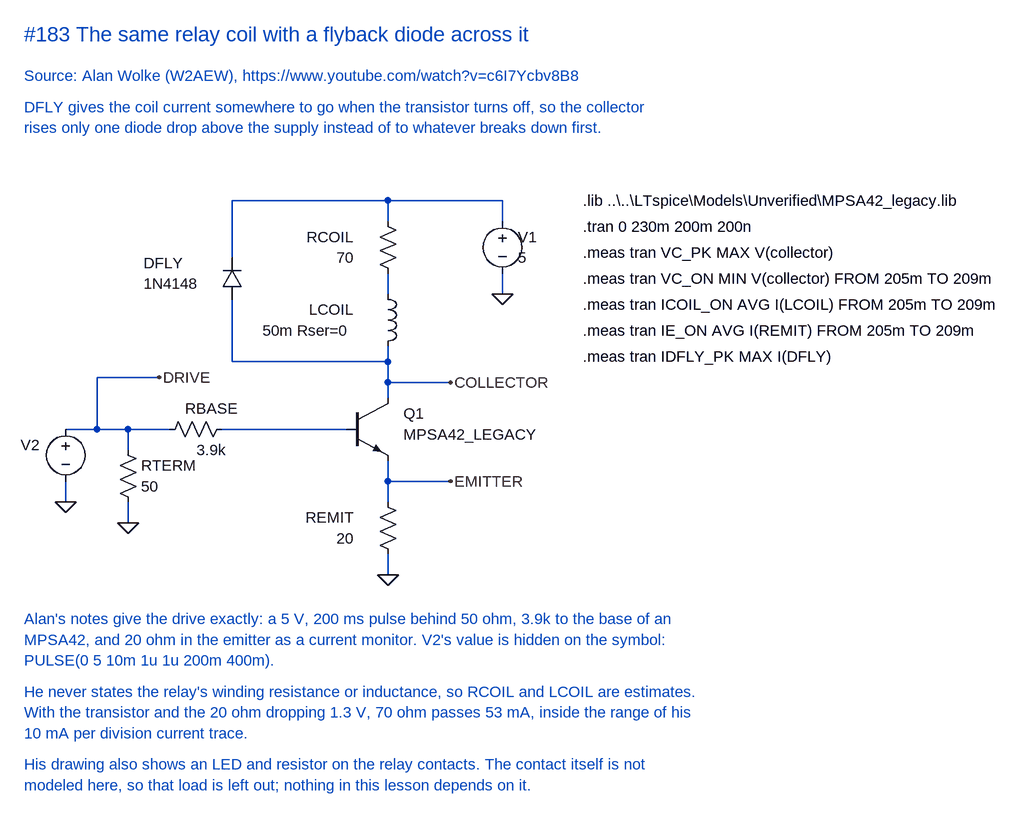
[diagram p0: schematic Relay with flyback diode.asc]
Relay with flyback diode.asc, the LTspice schematic file:
Version 4
SHEET 1 2000 1100
WIRE 480 256 720 256
WIRE 720 256 896 256
WIRE 480 256 480 344
WIRE 480 408 480 504
WIRE 480 504 720 504
WIRE 720 256 720 288
WIRE 896 256 896 288
WIRE 896 368 896 400
WIRE 720 368 720 400
WIRE 720 480 720 504
WIRE 720 504 720 536
WIRE 720 536 720 560
WIRE 720 536 816 536
WIRE 464 608 656 608
WIRE 320 608 384 608
WIRE 224 608 272 608
WIRE 272 608 320 608
WIRE 272 608 272 528
WIRE 272 528 368 528
WIRE 320 608 320 640
WIRE 320 720 320 752
WIRE 224 688 224 720
WIRE 720 656 720 688
WIRE 720 688 720 720
WIRE 720 688 816 688
WIRE 720 800 720 832
FLAG 896 400 0
FLAG 320 752 0
FLAG 224 720 0
FLAG 720 832 0
FLAG 816 536 COLLECTOR
FLAG 816 688 EMITTER
FLAG 368 528 DRIVE
SYMBOL diode 496 408 R180
WINDOW 0 152 56 Right 2
WINDOW 3 152 24 Right 2
SYMATTR InstName DFLY
SYMATTR Value 1N4148
SYMBOL voltage 896 272 R0
WINDOW 0 24 40 Left 2
WINDOW 3 24 72 Left 2
SYMATTR InstName V1
SYMATTR Value 5
SYMBOL voltage 224 592 R0
WINDOW 0 -40 40 Right 2
WINDOW 3 0 0 Invisible 2
SYMATTR InstName V2
SYMATTR Value PULSE(0 5 10m 1u 1u 200m 400m)
SYMBOL res 304 624 R0
WINDOW 0 36 40 Left 2
WINDOW 3 36 72 Left 2
SYMATTR InstName RTERM
SYMATTR Value 50
SYMBOL res 480 592 R90
WINDOW 0 0 32 VBottom 2
WINDOW 3 32 32 VTop 2
SYMATTR InstName RBASE
SYMATTR Value 3.9k
SYMBOL res 704 272 R0
WINDOW 0 -36 40 Right 2
WINDOW 3 -36 72 Right 2
SYMATTR InstName RCOIL
SYMATTR Value 70
SYMBOL ind 704 384 R0
WINDOW 0 -36 40 Right 2
WINDOW 3 -44 72 Right 2
SYMATTR InstName LCOIL
SYMATTR Value 50m Rser=0
SYMBOL npn 656 560 R0
WINDOW 0 88 24 Left 2
WINDOW 3 88 56 Left 2
SYMATTR InstName Q1
SYMATTR Value MPSA42_LEGACY
SYMBOL res 704 704 R0
WINDOW 0 -36 40 Right 2
WINDOW 3 -36 72 Right 2
SYMATTR InstName REMIT
SYMATTR Value 20
TEXT 160 0 Left 3 ;#183 The same relay coil with a flyback diode across it
TEXT 160 64 Left 2 ;Source: Alan Wolke (W2AEW), https://www.youtube.com/watch?v=c6I7Ycbv8B8
TEXT 160 112 Left 2 ;DFLY gives the coil current somewhere to go when the transistor turns off, so the collector
TEXT 160 144 Left 2 ;rises only one diode drop above the supply instead of to whatever breaks down first.
TEXT 1020 256 Left 2 !.lib ..\..\LTspice\Models\Unverified\MPSA42_legacy.lib
TEXT 1020 296 Left 2 !.tran 0 230m 200m 200n
TEXT 1020 336 Left 2 !.meas tran VC_PK MAX V(collector)
TEXT 1020 496 Left 2 !.meas tran IDFLY_PK MAX I(DFLY)
TEXT 1020 376 Left 2 !.meas tran VC_ON MIN V(collector) FROM 205m TO 209m
TEXT 1020 416 Left 2 !.meas tran ICOIL_ON AVG I(LCOIL) FROM 205m TO 209m
TEXT 1020 456 Left 2 !.meas tran IE_ON AVG I(REMIT) FROM 205m TO 209m
TEXT 160 900 Left 2 ;Alan's notes give the drive exactly: a 5 V, 200 ms pulse behind 50 ohm, 3.9k to the base of an
TEXT 160 932 Left 2 ;MPSA42, and 20 ohm in the emitter as a current monitor. V2's value is hidden on the symbol:
TEXT 160 964 Left 2 ;PULSE(0 5 10m 1u 1u 200m 400m).
TEXT 160 1012 Left 2 ;He never states the relay's winding resistance or inductance, so RCOIL and LCOIL are estimates.
TEXT 160 1044 Left 2 ;With the transistor and the 20 ohm dropping 1.3 V, 70 ohm passes 53 mA, inside the range of his
TEXT 160 1076 Left 2 ;10 mA per division current trace.
TEXT 160 1124 Left 2 ;His drawing also shows an LED and resistor on the relay contacts. The contact itself is not
TEXT 160 1156 Left 2 ;modeled here, so that load is left out; nothing in this lesson depends on it.

The netlist it stands for:
* Relay with flyback diode.asc
DFLY COLLECTOR N001 1N4148
V1 N001 0 5
V2 DRIVE 0 PULSE(0 5 10m 1u 1u 200m 400m)
RTERM DRIVE 0 50
RBASE N003 DRIVE 3.9k
RCOIL N001 N002 70
LCOIL N002 COLLECTOR 50m Rser=0
Q1 COLLECTOR N003 EMITTER 0 MPSA42_LEGACY
REMIT EMITTER 0 20
.model D D
.lib standard.dio
.model NPN NPN
.model PNP PNP
.lib standard.bjt
* #183 The same relay coil with a flyback diode across it
* Source: Alan Wolke (W2AEW), https://www.youtube.com/watch?v=c6I7Ycbv8B8
* DFLY gives the coil current somewhere to go when the transistor turns off, so the collector
* rises only one diode drop above the supply instead of to whatever breaks down first.
.lib ..\..\LTspice\Models\Unverified\MPSA42_legacy.lib
.tran 0 230m 200m 200n
.meas tran VC_PK MAX V(collector)
.meas tran IDFLY_PK MAX I(DFLY)
.meas tran VC_ON MIN V(collector) FROM 205m TO 209m
.meas tran ICOIL_ON AVG I(LCOIL) FROM 205m TO 209m
.meas tran IE_ON AVG I(REMIT) FROM 205m TO 209m
* Alan's notes give the drive exactly: a 5 V, 200 ms pulse behind 50 ohm, 3.9k to the base of an
* MPSA42, and 20 ohm in the emitter as a current monitor. V2's value is hidden on the symbol:
* PULSE(0 5 10m 1u 1u 200m 400m).
* He never states the relay's winding resistance or inductance, so RCOIL and LCOIL are estimates.
* With the transistor and the 20 ohm dropping 1.3 V, 70 ohm passes 53 mA, inside the range of his
* 10 mA per division current trace.
* His drawing also shows an LED and resistor on the relay contacts. The contact itself is not
* modeled here, so that load is left out; nothing in this lesson depends on it.
.backanno
.end